# Altium schematic sheet Top_Sheet.SchDoc
size 420 x 297 mm; DocumentNumber: 1; SheetNumber: 1; SheetTotal: 17
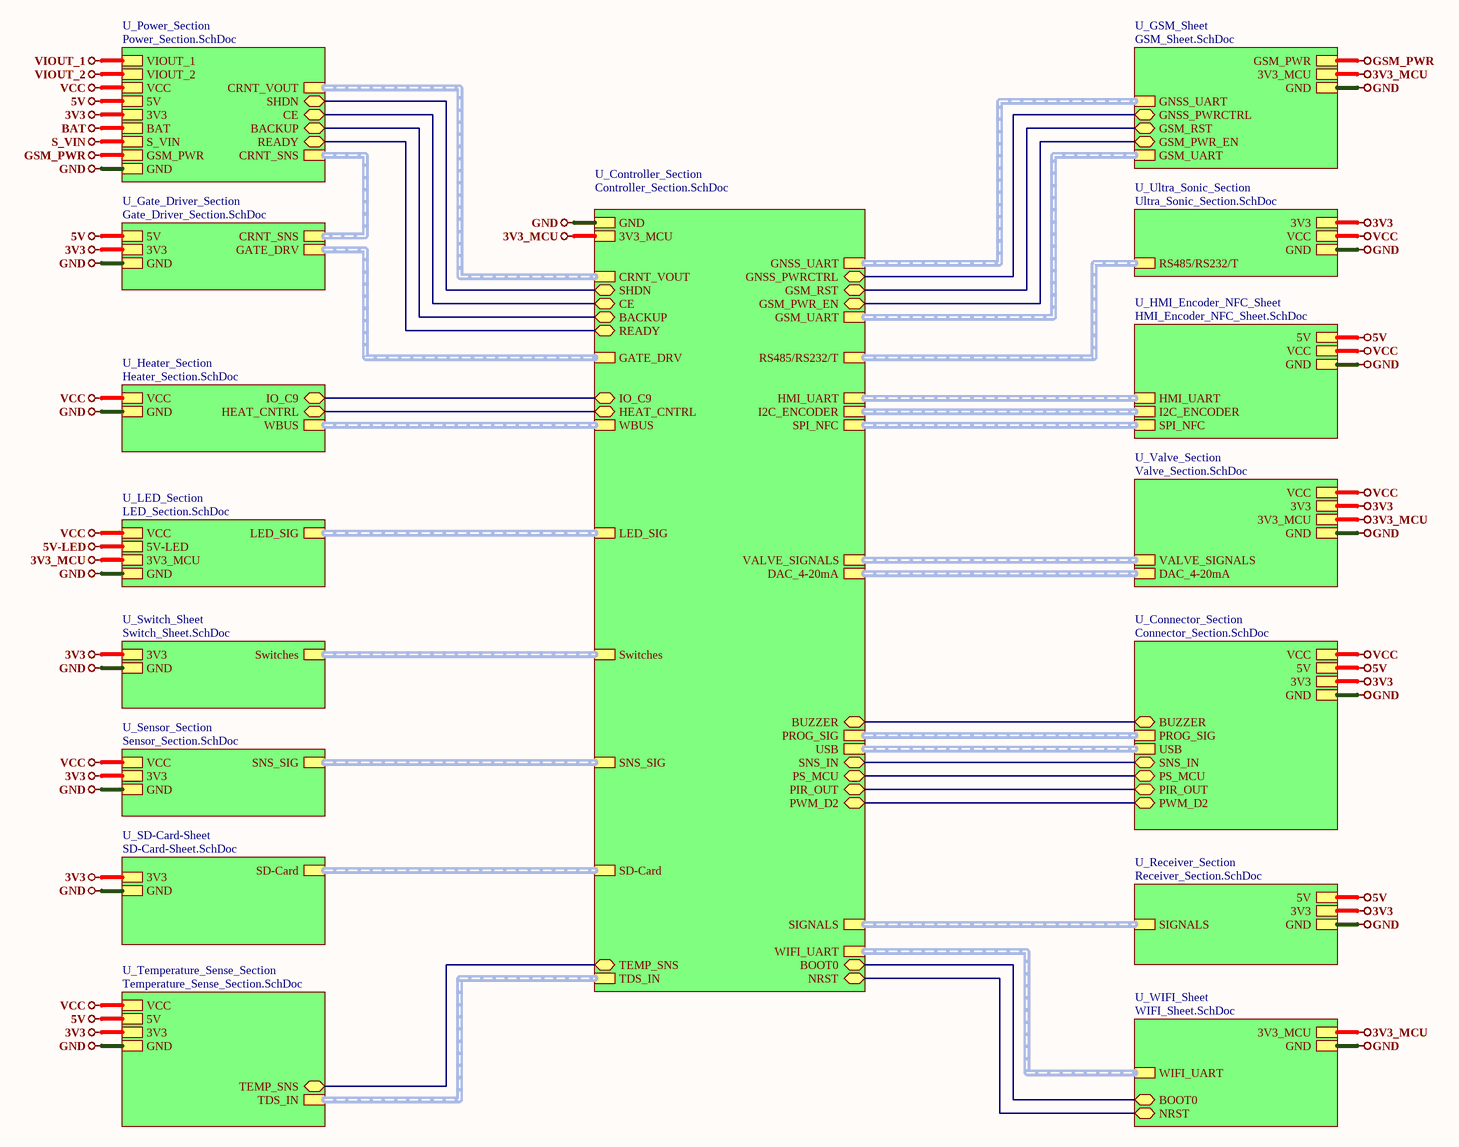
[diagram p0: Top_Sheet.SchDoc]

## Sub-sheets
U_Connector_Section = Connector_Section.SchDoc: PROG_SIG (harness PROG_SIG), BUZZER (bidir), VCC, 5V, 3V3, GND, PS_MCU (bidir), SNS_IN (bidir), PIR_OUT (bidir), USB (harness USB), PWM_D2 (bidir)
U_Controller_Section = Controller_Section.SchDoc: PROG_SIG (harness PROG_SIG), BUZZER (bidir), GATE_DRV (harness GATE_DRV), IO_C9 (bidir), GND, 3V3_MCU, SHDN (bidir), Switches (harness Switches), LED_SIG (harness LED_SIG), HEAT_CNTRL (bidir), VALVE_SIGNALS (harness VALVE_SIGNALS), SNS_SIG (harness SNS_SIG), PS_MCU (bidir), SNS_IN (bidir), SIGNALS (harness RF_SIG), PIR_OUT (bidir), CRNT_VOUT (harness CRNT_VOUT), TDS_IN (harness TDS_IN), USB (harness USB), PWM_D2 (bidir), CE (bidir), I2C_ENCODER (harness VALVE_SIGNALS), HMI_UART (harness VALVE_SIGNALS), GSM_UART (harness GSM_UART), GSM_PWR_EN (bidir), GSM_RST (bidir), TEMP_SNS (bidir), SPI_NFC (harness VALVE_SIGNALS), RS485/RS232/T (harness RS485/RS232/T), SD-Card (harness SD-Card), GNSS_PWRCTRL (bidir), READY (bidir), BACKUP (bidir), WIFI_UART (harness PROG_SIG), DAC_4-20mA (harness RF_SIG), BOOT0 (bidir), NRST (bidir), GNSS_UART (harness GSM_UART), WBUS (harness WBUS)
U_Gate_Driver_Section = Gate_Driver_Section.SchDoc: GATE_DRV (harness GATE_DRV), 5V, GND, CRNT_SNS (harness CRNT_SNS), 3V3
U_GSM_Sheet = GSM_Sheet.SchDoc: GSM_UART (harness GSM_UART), GND, GSM_PWR, 3V3_MCU, GSM_RST (bidir), GSM_PWR_EN (bidir), GNSS_PWRCTRL (bidir), GNSS_UART (harness GSM_UART)
U_Heater_Section = Heater_Section.SchDoc: IO_C9 (bidir), VCC, GND, HEAT_CNTRL (bidir), WBUS (harness WBUS)
U_HMI_Encoder_NFC_Sheet = HMI_Encoder_NFC_Sheet.SchDoc: 5V, GND, HMI_UART (harness HMI_UART), I2C_ENCODER (harness ENCODER), VCC, SPI_NFC (harness ENCODER)
U_LED_Section = LED_Section.SchDoc: LED_SIG (harness LED_SIG), VCC, GND, 5V-LED, 3V3_MCU
U_Power_Section = Power_Section.SchDoc: VIOUT_1, VIOUT_2, VCC, 5V, 3V3, GND, CRNT_SNS (harness CRNT_SNS), SHDN (bidir), CRNT_VOUT (harness CRNT_VOUT), BAT, S_VIN, CE (bidir), GSM_PWR, BACKUP (bidir), READY (bidir)
U_Receiver_Section = Receiver_Section.SchDoc: SIGNALS (harness RF_SIG), 5V, GND, 3V3
U_SD-Card-Sheet = SD-Card-Sheet.SchDoc: SD-Card (harness SD-Card), 3V3, GND
U_Sensor_Section = Sensor_Section.SchDoc: SNS_SIG (harness SNS_SIG), VCC, GND, 3V3
U_Switch_Sheet = Switch_Sheet.SchDoc: Switches (harness Switches), GND, 3V3
U_Temperature_Sense_Section = Temperature_Sense_Section.SchDoc: 5V, GND, 3V3, TDS_IN (harness TDS_IN), TEMP_SNS (bidir), VCC
U_Ultra_Sonic_Section = Ultra_Sonic_Section.SchDoc: GND, 3V3, RS485/RS232/T (harness RS485/RS232/T), VCC
U_Valve_Section = Valve_Section.SchDoc: VALVE_SIGNALS (harness VALVE_SIGNALS), VCC, GND, DAC_4-20mA (harness RF_SIG), 3V3, 3V3_MCU
U_WIFI_Sheet = WIFI_Sheet.SchDoc: 3V3_MCU, GND, WIFI_UART (harness PROG_SIG), NRST (bidir), BOOT0 (bidir)

## Nets
3V3: sheet U_Power_Section/3V3, sheet U_Connector_Section/3V3, sheet U_Receiver_Section/3V3, sheet U_SD-Card-Sheet/3V3, sheet U_Valve_Section/3V3, sheet U_Temperature_Sense_Section/3V3, sheet U_Sensor_Section/3V3, sheet U_Gate_Driver_Section/3V3, sheet U_Switch_Sheet/3V3, sheet U_Ultra_Sonic_Section/3V3
3V3_MCU: sheet U_Controller_Section/3V3_MCU, sheet U_GSM_Sheet/3V3_MCU, sheet U_WIFI_Sheet/3V3_MCU, sheet U_Valve_Section/3V3_MCU, sheet U_LED_Section/3V3_MCU
5V: sheet U_Power_Section/5V, sheet U_Connector_Section/5V, sheet U_Receiver_Section/5V, sheet U_Temperature_Sense_Section/5V, sheet U_Gate_Driver_Section/5V, sheet U_HMI_Encoder_NFC_Sheet/5V
5V-LED: sheet U_LED_Section/5V-LED
BAT: sheet U_Power_Section/BAT
GND: sheet U_Power_Section/GND, sheet U_Connector_Section/GND, sheet U_Receiver_Section/GND, sheet U_Controller_Section/GND, sheet U_GSM_Sheet/GND, sheet U_SD-Card-Sheet/GND, sheet U_WIFI_Sheet/GND, sheet U_Valve_Section/GND, sheet U_Temperature_Sense_Section/GND, sheet U_Sensor_Section/GND, sheet U_Gate_Driver_Section/GND, sheet U_Switch_Sheet/GND, sheet U_LED_Section/GND, sheet U_HMI_Encoder_NFC_Sheet/GND, sheet U_Ultra_Sonic_Section/GND, sheet U_Heater_Section/GND
GSM_PWR: sheet U_Power_Section/GSM_PWR, sheet U_GSM_Sheet/GSM_PWR
S_VIN: sheet U_Power_Section/S_VIN
VCC: sheet U_Power_Section/VCC, sheet U_Connector_Section/VCC, sheet U_Valve_Section/VCC, sheet U_Temperature_Sense_Section/VCC, sheet U_Sensor_Section/VCC, sheet U_LED_Section/VCC, sheet U_HMI_Encoder_NFC_Sheet/VCC, sheet U_Ultra_Sonic_Section/VCC, sheet U_Heater_Section/VCC
VIOUT_1: sheet U_Power_Section/VIOUT_1
VIOUT_2: sheet U_Power_Section/VIOUT_2
(unnamed): sheet U_Power_Section/SHDN, sheet U_Controller_Section/SHDN
(unnamed): sheet U_Power_Section/CE, sheet U_Controller_Section/CE
(unnamed): sheet U_Power_Section/BACKUP, sheet U_Controller_Section/BACKUP
(unnamed): sheet U_Power_Section/READY, sheet U_Controller_Section/READY
(unnamed): sheet U_Connector_Section/BUZZER, sheet U_Controller_Section/BUZZER
(unnamed): sheet U_Connector_Section/PS_MCU, sheet U_Controller_Section/PS_MCU
(unnamed): sheet U_Connector_Section/SNS_IN, sheet U_Controller_Section/SNS_IN
(unnamed): sheet U_Connector_Section/PIR_OUT, sheet U_Controller_Section/PIR_OUT
(unnamed): sheet U_Connector_Section/PWM_D2, sheet U_Controller_Section/PWM_D2
(unnamed): sheet U_Controller_Section/IO_C9, sheet U_Heater_Section/IO_C9
(unnamed): sheet U_Controller_Section/HEAT_CNTRL, sheet U_Heater_Section/HEAT_CNTRL
(unnamed): sheet U_Controller_Section/GSM_PWR_EN, sheet U_GSM_Sheet/GSM_PWR_EN
(unnamed): sheet U_Controller_Section/GSM_RST, sheet U_GSM_Sheet/GSM_RST
(unnamed): sheet U_Controller_Section/TEMP_SNS, sheet U_Temperature_Sense_Section/TEMP_SNS
(unnamed): sheet U_Controller_Section/GNSS_PWRCTRL, sheet U_GSM_Sheet/GNSS_PWRCTRL
(unnamed): sheet U_Controller_Section/BOOT0, sheet U_WIFI_Sheet/BOOT0
(unnamed): sheet U_Controller_Section/NRST, sheet U_WIFI_Sheet/NRST

## Buses and harness runs
harness sheet U_Connector_Section/PROG_SIG = sheet U_Controller_Section/PROG_SIG
harness sheet U_Connector_Section/USB = sheet U_Controller_Section/USB
harness sheet U_Controller_Section/CRNT_VOUT = sheet U_Power_Section/CRNT_VOUT
harness sheet U_Controller_Section/DAC_4-20mA = sheet U_Valve_Section/DAC_4-20mA
harness sheet U_Controller_Section/GATE_DRV = sheet U_Gate_Driver_Section/GATE_DRV
harness sheet U_Controller_Section/GNSS_UART = sheet U_GSM_Sheet/GNSS_UART
harness sheet U_Controller_Section/GSM_UART = sheet U_GSM_Sheet/GSM_UART
harness sheet U_Controller_Section/HMI_UART = sheet U_HMI_Encoder_NFC_Sheet/HMI_UART
harness sheet U_Controller_Section/I2C_ENCODER = sheet U_HMI_Encoder_NFC_Sheet/I2C_ENCODER
harness sheet U_Controller_Section/LED_SIG = sheet U_LED_Section/LED_SIG
harness sheet U_Controller_Section/RS485/RS232/T = sheet U_Ultra_Sonic_Section/RS485/RS232/T
harness sheet U_Controller_Section/SD-Card = sheet U_SD-Card-Sheet/SD-Card
harness sheet U_Controller_Section/SIGNALS = sheet U_Receiver_Section/SIGNALS
harness sheet U_Controller_Section/SNS_SIG = sheet U_Sensor_Section/SNS_SIG
harness sheet U_Controller_Section/SPI_NFC = sheet U_HMI_Encoder_NFC_Sheet/SPI_NFC
harness sheet U_Controller_Section/Switches = sheet U_Switch_Sheet/Switches
harness sheet U_Controller_Section/TDS_IN = sheet U_Temperature_Sense_Section/TDS_IN
harness sheet U_Controller_Section/VALVE_SIGNALS = sheet U_Valve_Section/VALVE_SIGNALS
harness sheet U_Controller_Section/WBUS = sheet U_Heater_Section/WBUS
harness sheet U_Controller_Section/WIFI_UART = sheet U_WIFI_Sheet/WIFI_UART
harness sheet U_Gate_Driver_Section/CRNT_SNS = sheet U_Power_Section/CRNT_SNS

## Notes on the sheet
- File:
- Title:
- Date:
- Page
- Num:
- Total:
- Drawn By: Huzaifa Ali